# Altium project Emstat_system.PrjPcb
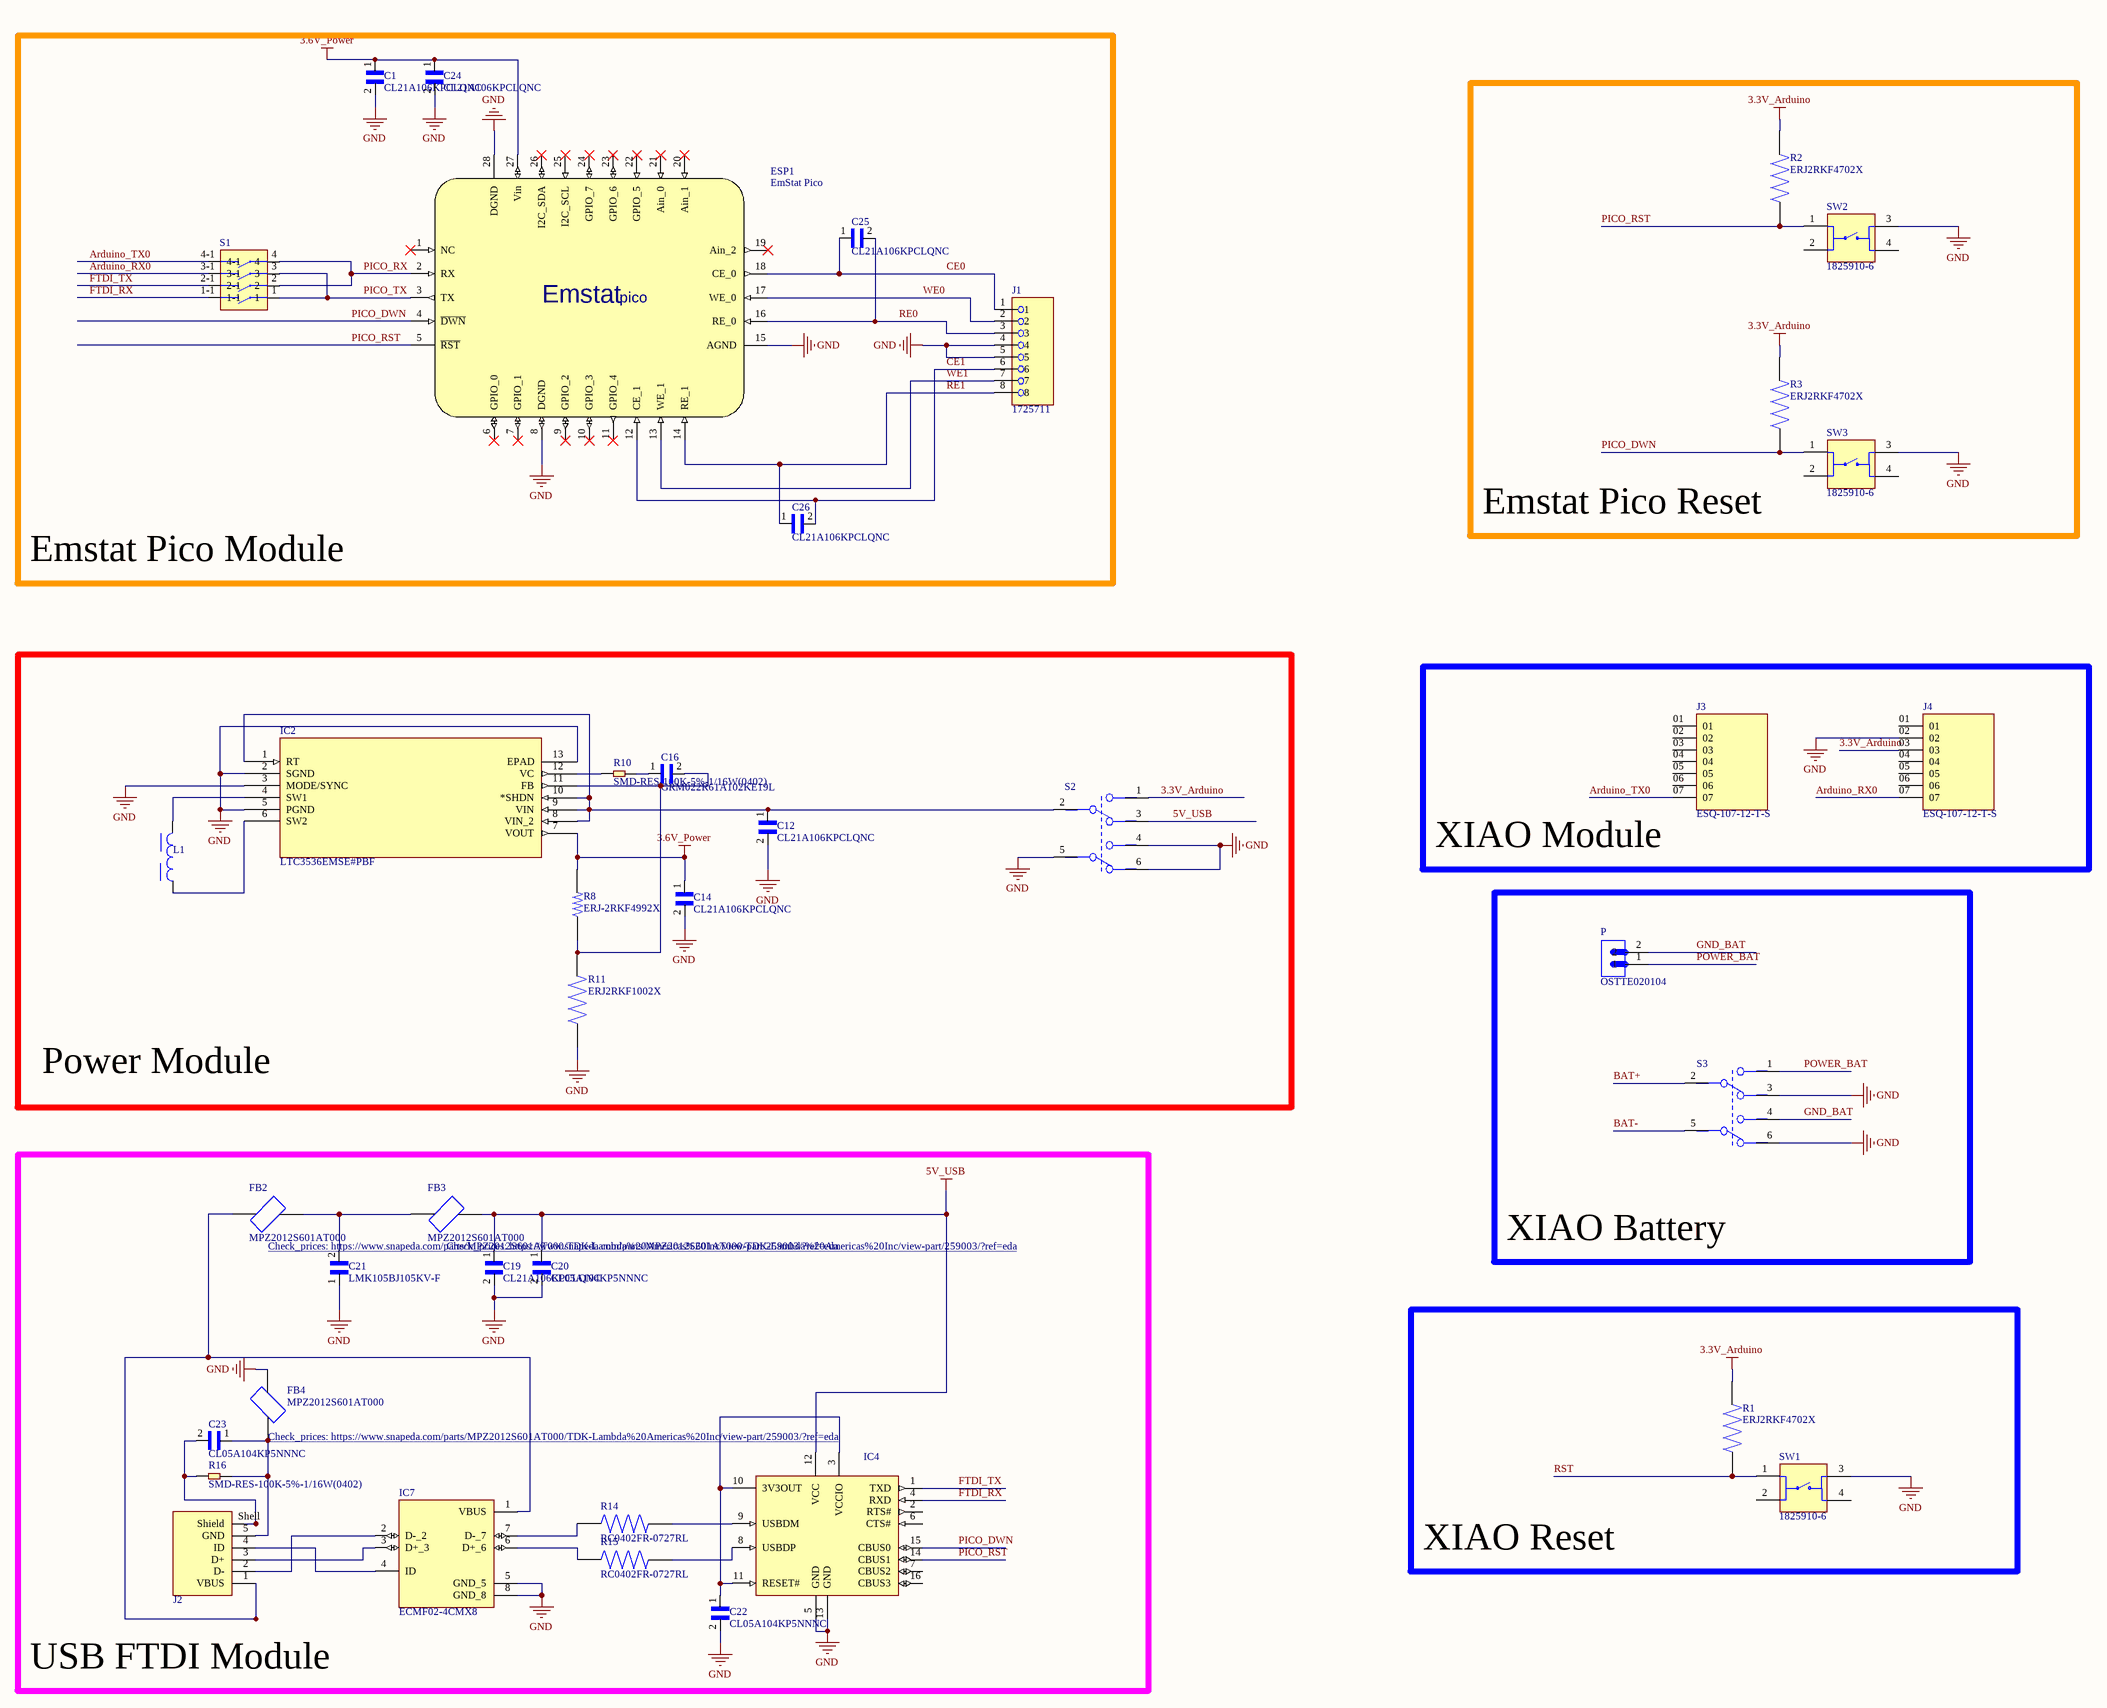
[diagram p0: Emstat_system.SchDoc]
1 sheet, 40 parts. Net scope: global (net labels, ports and power ports of the same name join across sheets).
Board file: Emstat_system.PcbDoc

## Sheet Emstat_system.SchDoc
size C; SheetNumber: 1; SheetTotal: 1

### Parts
C1  CL21A106KPCLQNC  [CAPC2012X95N]
C12  CL21A106KPCLQNC  [CAPC2012X95N]
C14  CL21A106KPCLQNC  [CAPC2012X95N]
C16  GRM022R61A102KE19L  [CAPC0402X22N]
C19  CL21A106KPCLQNC  [CAPC2012X95N]
C20  CL05A104KP5NNNC  [CAPC1005X55N]
C21  LMK105BJ105KV-F  [CAPC1005X55N]
C22  CL05A104KP5NNNC  [CAPC1005X55N]
C23  CL05A104KP5NNNC  [CAPC1005X55N]
C24  CL21A106KPCLQNC  [CAPC2012X95N]
C25  CL21A106KPCLQNC  [CAPC2012X95N]
C26  CL21A106KPCLQNC  [CAPC2012X95N]
ESP1  EmStat Pico  [EmstatPico]
FB2  MPZ2012S601AT000  [BEADC2012X105N]
FB3  MPZ2012S601AT000  [BEADC2012X105N]
FB4  MPZ2012S601AT000  [BEADC2012X105N]
IC2  LTC3536EMSE#PBF  [MSOP-12_MSE]
IC4  (no value)  [SSOP-16_M]
IC7  ECMF02-4CMX8  [FIL_ECMF02-4CMX8]
J1  1725711  [PHOENIX_1725711]
J2  629105150521  [629105150521]  (value not drawn)
J3  ESQ-107-12-T-S  [SAMTEC_ESQ-107-12-T-S]
J4  ESQ-107-12-T-S  [SAMTEC_ESQ-107-12-T-S]
L1  4.7uH, 1.3A  [WE-LQS_3015]  (value not drawn)
P  OSTTE020104  [OST_OSTTE020104]
R1  ERJ2RKF4702X  [RES_ERJ2RKF4702X]
R2  ERJ2RKF4702X  [RES_ERJ2RKF4702X]
R3  ERJ2RKF4702X  [RES_ERJ2RKF4702X]
R8  ERJ-2RKF4992X  [RESC1005X40]
R10  SMD-RES-100K-5%-1/16W(0402)  [R0402]
R11  ERJ2RKF1002X  [RES_ERJ2RKF1002X]
R14  RC0402FR-0727RL  [RESC1005X40]
R15  RC0402FR-0727RL  [RESC1005X40]
R16  SMD-RES-100K-5%-1/16W(0402)  [R0402]
S1  (no value)  [FP-1571983-4-MFG]
S2  (no value)  [FP-JS202011SCQN-MFG]
S3  (no value)  [FP-JS202011SCQN-MFG]
SW1  1825910-6  [SW_1825910-6-4]
SW2  1825910-6  [SW_1825910-6-4]
SW3  1825910-6  [SW_1825910-6-4]

### Blocks framed on the sheet
Emstat Pico Module: C1 C24-C26 ESP1 J1 S1
Emstat Pico Reset: R2 R3 SW2 SW3
Power Module: C12 C14 C16 IC2 L1 R8 R10 R11 S2
XIAO Module: J3 J4
XIAO Battery: P S3
USB FTDI Module: C19-C23 FB2-FB4 IC4 IC7 J2 R14-R16
XIAO Reset: R1 SW1

### Nets
3.3V_Arduino: J4.03 R1.2 R2.2 R3.2 S2.1
3.6V_Power: C1.1 C14.1 C24.1 ESP1.27(Vin) IC2.7(VOUT) R8.2
5V_USB: C19.1 C20.1 FB3.2 IC4.12(VCC) S2.3
GND: C1.2 C12.2 C14.2 C19.2 C20.2 C21.1 C22.2 C24.2 ESP1.8(DGND) ESP1.15(AGND) ESP1.28(DGND) FB4.2 IC2.2(SGND) IC2.3(MODE/SYNC) IC2.5(PGND) IC2.13(EPAD) IC4.5(GND) IC4.13(GND) IC7.5(GND_5) IC7.8(GND_8) J1.4 J1.5 J4.02 R11.1 S2.4 S2.5 S2.6 S3.3 S3.6 SW1.3 SW2.3 SW3.3
Arduino_RX0: J4.07 S1.3-1
Arduino_TX0: J3.07 S1.4-1
BAT+: S3.2
BAT-: S3.5
CE0: C25.1 ESP1.18(CE_0) J1.1
CE1: C26.2 ESP1.12(CE_1) J1.6
FTDI_RX: IC4.4(RXD) S1.1-1
FTDI_TX: IC4.1(TXD) S1.2-1
GND_BAT: P.2 S3.4
PICO_DWN: ESP1.4(~{DWN}) IC4.15(CBUS0) R3.1 SW3.1
PICO_RST: ESP1.5(~{RST}) IC4.14(CBUS1) R2.1 SW2.1
PICO_RX: ESP1.2(RX) S1.2 S1.4
PICO_TX: ESP1.3(TX) S1.1 S1.3
POWER_BAT: P.1 S3.1
RE0: C25.2 ESP1.16(RE_0) J1.3
RE1: C26.1 ESP1.14(RE_1) J1.8
RST: R1.1 SW1.1
WE0: ESP1.17(WE_0) J1.2
WE1: ESP1.13(WE_1) J1.7
NetC12_1: C12.1 IC2.1(RT) IC2.8(VIN_2) IC2.9(VIN) IC2.10(*SHDN) S2.2
NetC16_1: C16.1 R10.2
NetC16_2: C16.2 IC2.11(FB) R8.1 R11.2
NetC21_2: C21.2 FB2.2 FB3.1
NetC22_1: C22.1 IC4.3(VCCIO) IC4.10(3V3OUT) IC4.11(RESET#)
NetC23_1: C23.1 FB4.1 J2.5(GND) R16.2
NetC23_2: C23.2 J2.Shell(Shield) R16.1
NetFB2_1: FB2.1 IC7.1(VBUS) J2.1(VBUS)
NetIC2_4: IC2.4(SW1) L1.2
NetIC2_6: IC2.6(SW2) L1.1
NetIC2_12: IC2.12(VC) R10.1
NetIC4_8: IC4.8(USBDP) R15.2
NetIC4_9: IC4.9(USBDM) R14.2
NetIC7_2: IC7.2(D-_2) J2.2(D-)
NetIC7_3: IC7.3(D+_3) J2.3(D+)
NetIC7_4: IC7.4(ID) J2.4(ID)
NetIC7_6: IC7.6(D+_6) R15.1
NetIC7_7: IC7.7(D-_7) R14.1

Not connected (* = marked no-connect by the designer): ESP1 1(NC)* 6(GPIO_0)* 7(GPIO_1)* 9(GPIO_2)* 10(GPIO_3)* 11(GPIO_4)* 19(Ain_2)* 20(Ain_1)* 21(Ain_0)* 22(GPIO_5)* 23(GPIO_6)* 24(GPIO_7)* 25(I2C_SCL)* 26(I2C_SDA)*; IC4 2(RTS#) 6(CTS#) 7(CBUS2) 16(CBUS3); J3 01 02 03 04 05 06; J4 01 04 05 06; SW1 2 4; SW2 2 4; SW3 2 4

### Notes on the sheet
- (in symbol EmStat Pico) pico; Emstat

### Library data of the parts
C1 C12 C14 C19 C24-C26 = CL21A106KPCLQNC: 10 ÂµF Â±10% 10V Ceramic Capacitor X5R 0805 (2012 Metric); MF: Samsung; Package: Package; Digi-Key_Part_Number: 1276-2402-2-ND; Purchase-URL: https://pricing.snapeda.com/search/part/CL21A106KPCLQNC/?ref=eda; Value: *; MP: CL21A106KPCLQNC; Check_prices: https://www.snapeda.com/parts/CL21A106KPCLQNC/Samsung/view-part/?ref=eda; SnapEDA_Link: https://www.snapeda.com/parts/CL21A106KPCLQNC/Samsung/view-part/?ref=snap
C20 C22 C23 = CL05A104KP5NNNC: 0.1ÂµF Â±10% 10V Ceramic Capacitor X5R 0402 (1005 Metric); MF: Samsung Electro-Mechanics; Check_prices: https://www.snapeda.com/parts/CL05A104KP5NNNC/Samsung%20Electro-Mechanics/view-part/3598286/?ref=eda; Availability: Good; Price: None; Package: 0402 Samsung; MP: CL05A104KP5NNNC; Value: *; SnapEDA_Link: https://www.snapeda.com/parts/CL05A104KP5NNNC/Samsung%20Electro-Mechanics/view-part/3598286/?ref=snap; Purchase-URL: https://pricing.snapeda.com/search/part/CL05A104KP5NNNC/?ref=eda
  C22: Supplier 1: Avnet; Supplier Part Number 1: CL05A104KP5NNNC
C21 = LMK105BJ105KV-F: 1ÂµF Â±10% 10V Ceramic Capacitor X5R 0402 (1005 Metric); MF: Taiyo Yuden; Value: *; Check_prices: https://www.snapeda.com/parts/LMK105BJ105KV-F/Taiyo%20Yuden/view-part/1836611/?ref=eda; SnapEDA_Link: https://www.snapeda.com/parts/LMK105BJ105KV-F/Taiyo%20Yuden/view-part/1836611/?ref=snap; Availability: Good; MP: LMK105BJ105KV-F; Purchase-URL: https://pricing.snapeda.com/search/part/LMK105BJ105KV-F/?ref=eda; Package: 1005 Taiyo Yuden; Price: None
FB2-FB4 = MPZ2012S601AT000: 600 Ohms @ 100MHz 1 Power Line Ferrite Bead 0805 (2012 Metric) 2A 100mOhm; MF: TDK; SnapEDA_Link: https://www.snapeda.com/parts/MPZ2012S601AT000/TDK-Lambda%20Americas%20Inc/view-part/259003/?ref=snap; Value: *; Availability: Good; Purchase-URL: https://pricing.snapeda.com/search/part/MPZ2012S601AT000/?ref=eda; Price: None; MP: MPZ2012S601AT000; Package: 0805 TDK; Check_prices: https://www.snapeda.com/parts/MPZ2012S601AT000/TDK-Lambda%20Americas%20Inc/view-part/259003/?ref=eda
IC2 = LTC3536EMSE#PBF: 1A Low Noise, Buck-Boost DC/DC Converter; MF: Analog Devices; MP: LTC3536EMSE#PBF; Price: None; Check_prices: https://www.snapeda.com/parts/LTC3536EMSE%23PBF/Analog+Devices/view-part/?ref=eda; Package: MSOP -12 Analog Devices; Purchase-URL: https://pricing.snapeda.com/search/part/LTC3536EMSE#PBF/?ref=eda; Availability: In Stock; SnapEDA_Link: https://www.snapeda.com/parts/LTC3536EMSE%23PBF/Analog+Devices/view-part/?ref=snap; Value: *
IC4 = CMP-0248-00025-2: USB to Basic UART Interface Chip, UHCI/OHCI/EHCI Compatible, USB 2.0 Compatible, -40 to +85 degC, 16-Pin SSOP, Pb-Free, Tube; PartNumber: FT230XS-U; Manufacturer: FTDI; PackageDescription: 16-Pin Small Outline Package, 8.6 x 3.9 mm Body, 0.635 mm Pitch; ComponentLink2URL: http://www.ftdichip.com/Support/Documents/DataSheets/ICs/DS_FT230X.pdf; ComponentLink3URL: www.ftdichip.com/Products/ICs/FT230X.html; RevisionNote: DatasheetVersion updated to 1.2 Feb-2013; PackageVersion: Feb-13; ComponentLink2Description: Datasheet; Code_JEDEC: MO-137-AB; DatasheetVersion: ver 1.2, Feb-2013; ComponentLink1URL: http://www.ftdichip.com/; PackageReference: SSOP-16; ComponentLink1Description: Manufacturer URL; ComponentLink3Description: FT230X Product Page; Supplier 1: Digikey; Supplier Part Number 1: 768-1154-5-ND
IC7 = ECMF02-4CMX8: 2 Line Common Mode Choke Surface Mount DCR 4Ohm; MF: STMicroelectronics; SnapEDA_Link: https://www.snapeda.com/parts/ECMF02-4CMX8/STMicroelectronics/view-part/?ref=snap; Package: UFDFN-8 STMicroelectronics; Value: *; MP: ECMF02-4CMX8; Check_prices: https://www.snapeda.com/parts/ECMF02-4CMX8/STMicroelectronics/view-part/?ref=eda
J1 = 1725711: MF: Phoenix Contact; Package: None; Price: None; Value: *; MP: 1725711; Availability: Unavailable
J2 = 629105150521: WR-COM Micro USB 2.0 SMT Type B Horizontal 5 Contacts High Current; Manufacturer: Wurth Elektronik; Match Code: WR-USB; Gender: Receptacle; Interface Type: Type B; Number of Ports: 1; Rated Current: 3A; Working Voltage: 30V (AC); Manufacturer Part Number: 629105150521; Category: Input/Output Connectors; ComponentLink1Description: Website Link; ComponentLink1URL: https://www.we-online.com/redexpert/article/629105150521?ad; ComponentLink2Description: Datasheet Link; ComponentLink2URL: https://www.we-online.com/redexpert/spec/629105150521?ad; Mount: Surface Mount; Operating Temperature Max: 85°C; Operating Temperature Min: -40°C; Packaging: Tape and Reel; Application: Micro USB 2.0; Number of Pins: 5; Orientation: Horizontal
L1 = 74404032047: WE-LQS SMT Power Inductor, size 3015, 4.7uH, 1.3A, 0.096Ohm; Manufacturer: Wurth Elektronik; Case/Size Code: 3015; Saturation Current: 1.2A; Self Resonant Frequency: 56MHz; Manufacturer Part Number: 74404032047; Category: Power Inductors; Match Code: WE-LQS; ComponentLink1Description: Website Link; ComponentLink1URL: https://www.we-online.com/redexpert/article/74404032047?ad; ComponentLink2Description: Datasheet Link; ComponentLink2URL: https://www.we-online.com/redexpert/spec/74404032047?ad; Mount: Surface Mount; Operating Temperature Max: 125°C; Operating Temperature Min: -40°C; Packaging: Tape and Reel; Length: 3mm; Width: 3mm; Height: 1.5mm; DC Resistance: 0.096Ohm; Inductance: 4.7uH; Rated Current: 1.3A
P = OSTTE020104: 2 Position Wire to Board Terminal Block Horizontal with Board 0.138 _3.50mm_ Through Hole; MF: On Shore; Digi-Key_Purchase_URL: https://www.digikey.com/product-detail/en/on-shore-technology-inc/OSTTE020104/ED2740-ND/2351816?utm_source=snapeda&utm_medium=aggregator&utm_campaign=symbol; Value: *; Package: None; MP: OSTTE020104; Digi-Key_Part_Number: ED2740-ND; SnapEDA_Link: https://www.snapeda.com/parts/OSTTE020104/On%20Shore%20Technology%20Inc./view-part/274621/?ref=snap; Supplier 1: Digikey; Supplier Part Number 1: ED2740-ND
R8 = ERJ-2RKF4992X: 49.9 kOhms 1% 0.1W, 1/10W Chip Resistor 0402 (1005 Metric) Automotive AEC-Q200 Thick Film; MF: Panasonic Electronic; SnapEDA_Link: https://www.snapeda.com/parts/ERJ-2RKF4992X/Panasonic+Electronic+Components/view-part/?ref=snap; Package: 1005-2 Panasonic; Value: *; MP: ERJ-2RKF4992X; Check_prices: https://www.snapeda.com/parts/ERJ-2RKF4992X/Panasonic+Electronic+Components/view-part/?ref=eda
R10 R16 = SMD-RES-100K-5%-1/16W(0402): 100 kOhms Â±5% 0.063W, 1/16W Chip Resistor 0402 (1005 Metric) Moisture Resistant Thick Film; MF: Yageo; MP: RC0402JR-07100KL; Purchase-URL: https://pricing.snapeda.com/search?q=RC0402JR-07100KL&ref=eda; Package: 0402 Yageo; Check_prices: https://www.snapeda.com/parts/RC0402JR-07100KL/Yageo/view-part/?ref=eda; Value: *; SnapEDA_Link: https://www.snapeda.com/parts/RC0402JR-07100KL/Yageo/view-part/?ref=snap; Digi-Key_Part_Number: 311-100KJRTR-ND
R11 = ERJ2RKF1002X: 10 kOhms 1% 0.1W, 1/10W Chip Resistor 0402 (1005 Metric) Automotive AEC-Q200 Thick Film; MF: Panasonic; MP: ERJ-2RKF1002X; Package: 1005-2 Panasonic; Price: None; Check_prices: https://www.snapeda.com/parts/ERJ-2RKF1002X/Panasonic%20Electronic%20Components/view-part/78636/?ref=eda; Value: *; SnapEDA_Link: https://www.snapeda.com/parts/ERJ-2RKF1002X/Panasonic%20Electronic%20Components/view-part/78636/?ref=snap; Availability: In Stock
R14 R15 = RC0402FR-0727RL: Surface Mount Thick Film Resistor, RC Series, 27 ohm, 63 mW, - 1%, 50 V, 0402 [1005 Metric]; MF: Yageo; Digi-Key_Purchase_URL: https://www.digikey.com/product-detail/en/yageo/RC0402FR-0727RL/YAG3086CT-ND/5281951?utm_source=snapeda&utm_medium=aggregator&utm_campaign=symbol; Digi-Key_Part_Number: YAG3086CT-ND; Package: 1005 Panasonic Electronic Components; SnapEDA_Link: https://www.snapeda.com/parts/RC0402FR-0727RL/Yageo/view-part/938293/?ref=snap; MP: RC0402FR-0727RL; Value: *
S1 = 1571983-4: SWITCH SLIDE DIP SPST 25MA 24V; Price: None; MP: 1571983-4; Availability: Unavailable; Value: *; Package: None; Supplier 1: Future Electronics; Supplier Part Number 1: 9787847
S2 S3 = CMP-2000-05087-3: SWITCH SLIDE DPDT 300MA 6V; Switch Function: On-On; Actuator Type: Standard; Switch Travel: 2mm; Actuator Color: Black; Contact Resistance: 70mR; Electrical Life: 5000Cycles; Actuator Material: Nylon; REACH SVHC: No SVHC; Series: JS; Min Operating Temperature: -20°C; Depth: 7.5mm; Housing Material: Nylon; Voltage Rating (DC): 6V; Max Operating Temperature: 85°C; Contact Current Rating: 300mA; Package Quantity: 1; Contact Plating: Silver; Contact Material: Copper Alloy; Throw Configuration: DPDT; Current Rating: 300mA; Orientation: Vertical; Max Current Rating: 300mA; Max Voltage Rating (DC): 6V; Flammability Rating: UL94 V-2; Length: 9mm; Packaging: Tape and Reel; Mount: Surface Mount; Actuator Length: 2mm; Lead Free: Lead Free; Termination: Gull Wing; Radiation Hardening: No
SW1-SW3 = 1825910-6: Switch Push Button OFF (ON) SPST Round Button 0.05A 24VDC Momentary Contact PC Pins Thru-Hole; MF: TE Connectivity; Value: *; MP: 1825910-6; Package: None; Check_prices: https://www.snapeda.com/parts/1825910-6/TE+Connectivity+ALCOSWITCH+Switches/view-part/?ref=eda; SnapEDA_Link: https://www.snapeda.com/parts/1825910-6/TE+Connectivity+ALCOSWITCH+Switches/view-part/?ref=snap; Digi-Key_Part_Number: 450-1650-ND; Purchase-URL: https://pricing.snapeda.com/search/part/1825910-6/?ref=eda
C16 = GRM022R61A102KE19L: Package: None; Price: None; Value: *; MP: GRM022R61A102KE19L; Availability: Unavailable
J3 J4 = ESQ-107-12-T-S: Value: *; Availability: Unavailable; Package: None; Price: None; MP: ESQ-107-12-T-S
R1-R3 = ERJ2RKF4702X: Package: None; MP: ERJ2RKF4702X; Price: None; Availability: Unavailable; Value: *